# EasyEDA Pro project ProPrj_国赛底层板子_2026-05-31.epro, schematic 国赛底板b
Board Name: 国赛底板b; Create Date: 2025-09-20; Page Name: Sheet_1; Project Name: 底板b; Schematic Name: 国赛底板b; Update Date: 2025-09-20; Add into BOM: yes; Company: Your Company; Convert to PCB: yes; Date: 2024-07-17; Draw By: zjt55200; REV: 1.0; Sheet: 1/1
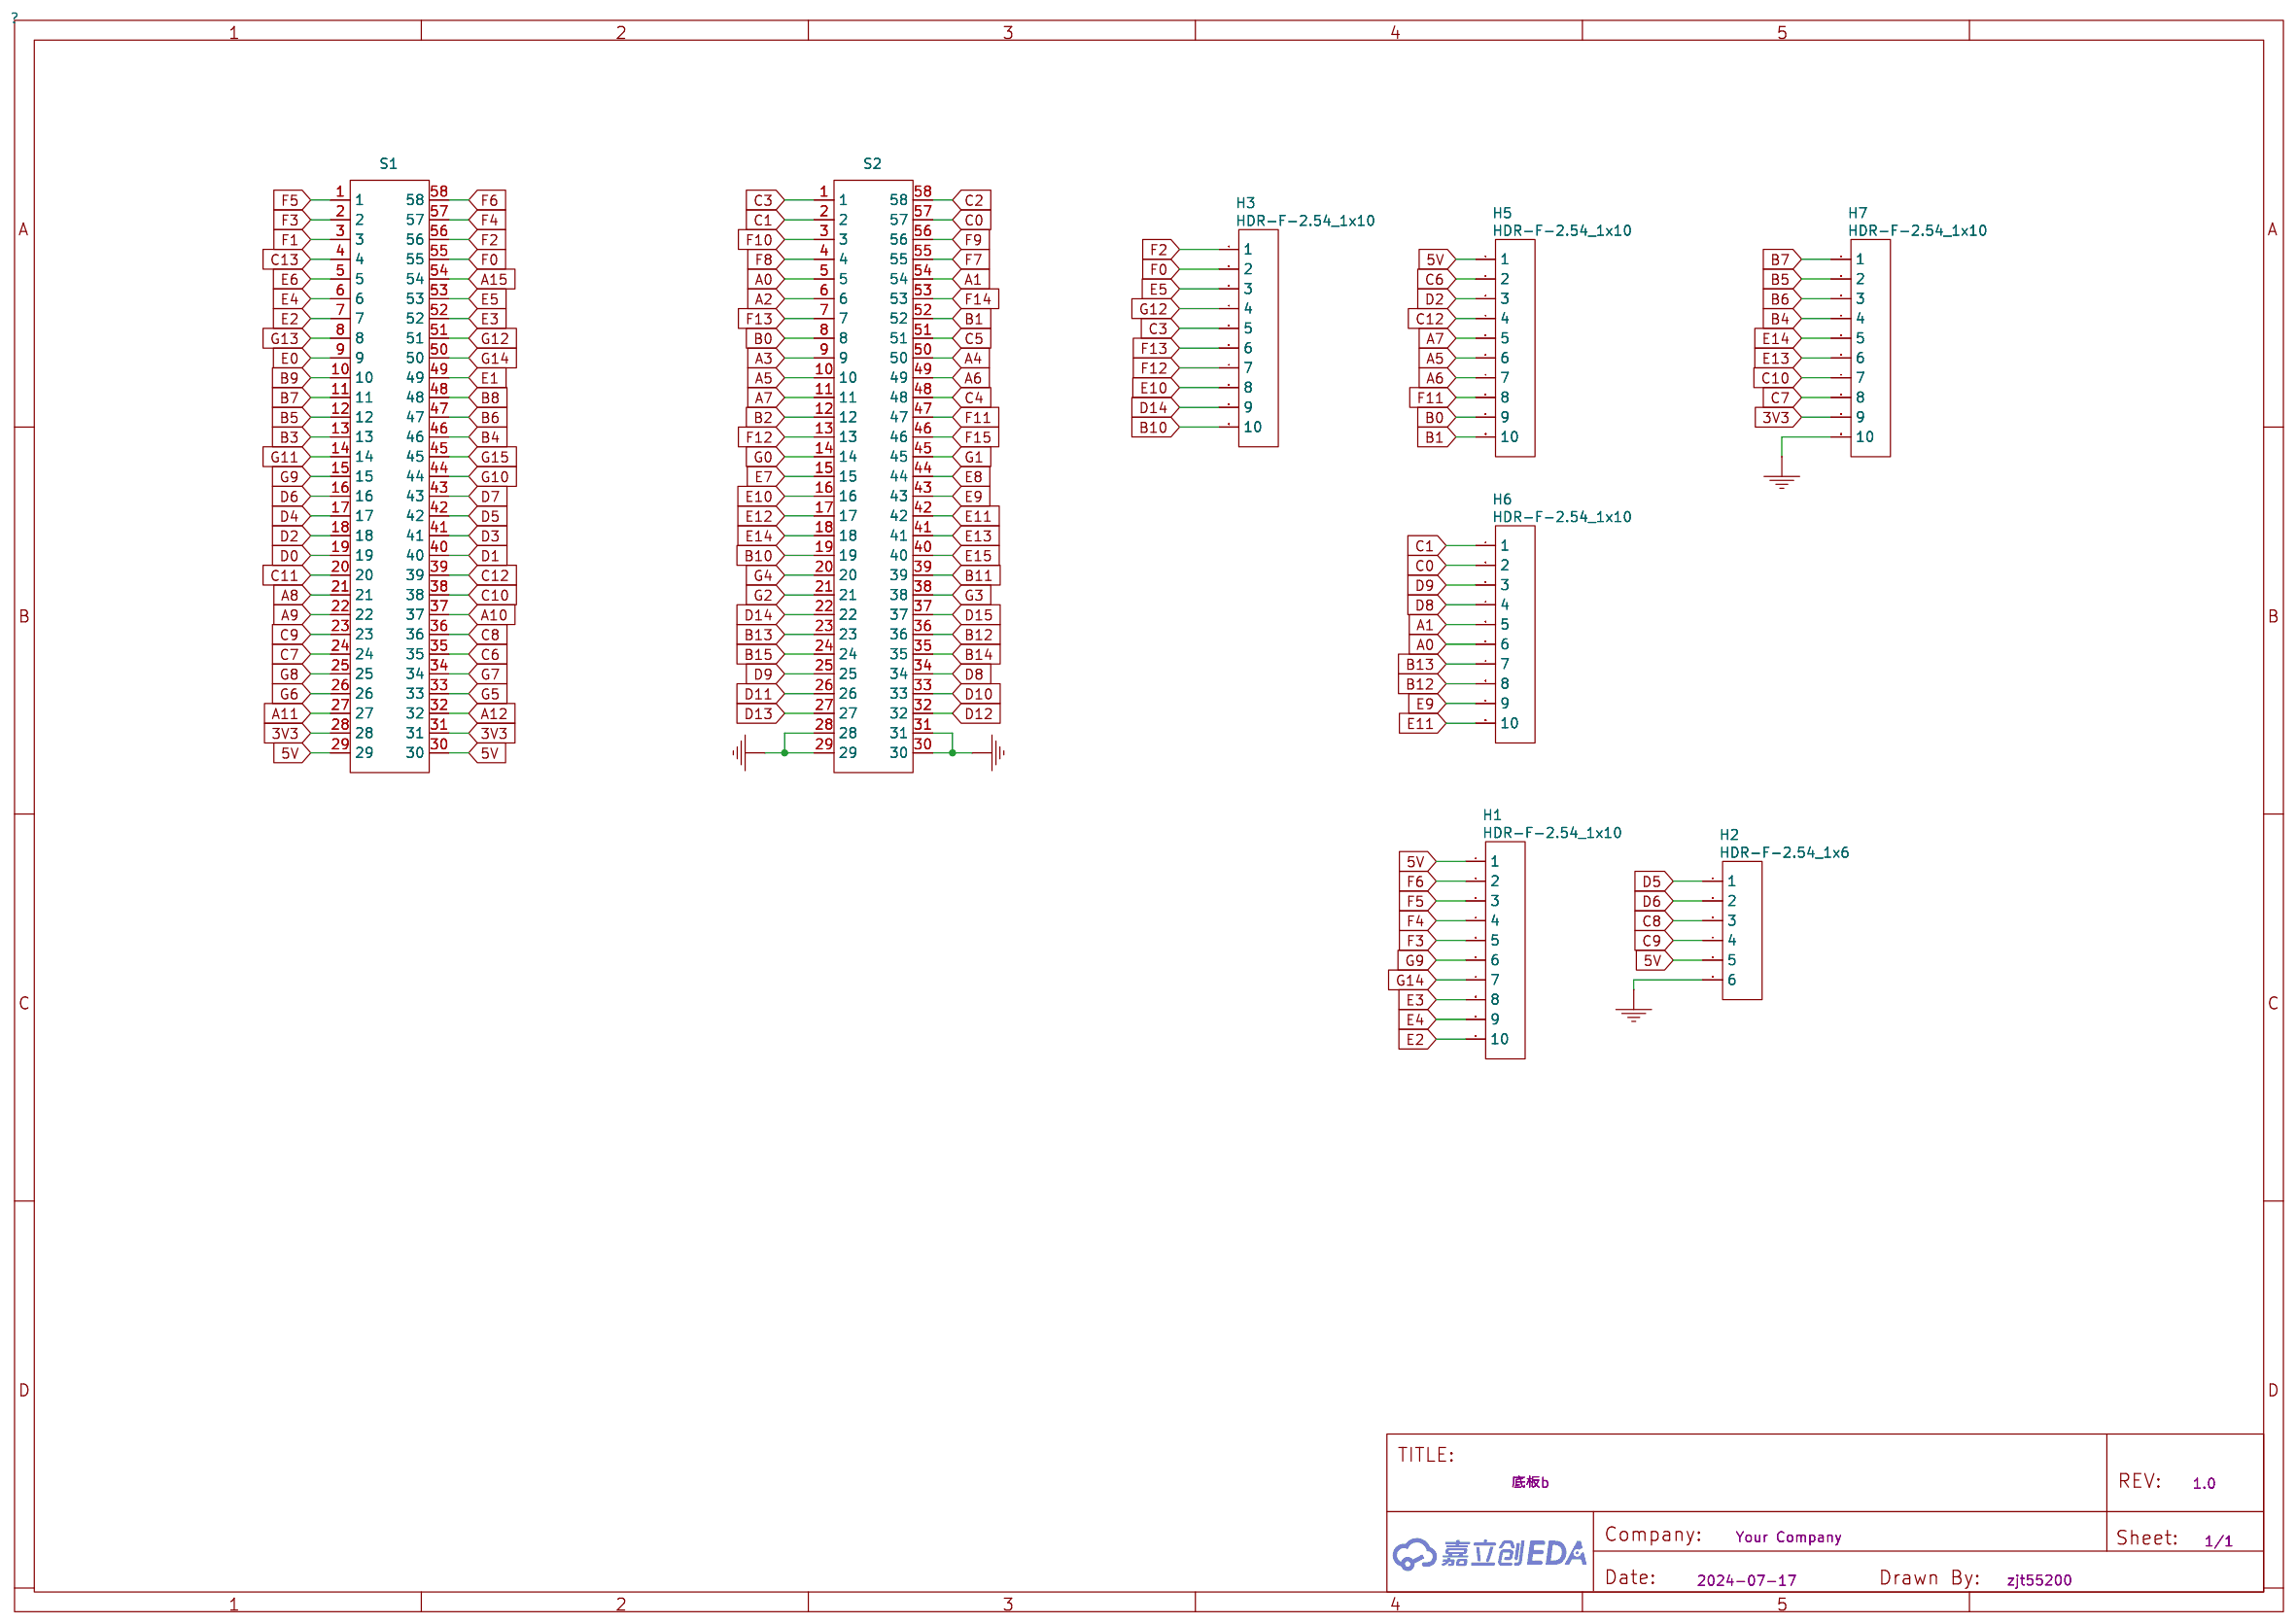
[diagram p3: schematic sheet]

## Parts
H1  HDR-F-2.54_1x10  [HDR-F-2.54_1X10]
H2  HDR-F-2.54_1x6  [HDR-F-2.54_1X6]
H3  HDR-F-2.54_1x10  [HDR-F-2.54_1X10]
H5  HDR-F-2.54_1x10  [HDR-F-2.54_1X10]
H6  HDR-F-2.54_1x10  [HDR-F-2.54_1X10]
H7  HDR-F-2.54_1x10  [HDR-F-2.54_1X10]
S1  双排29脚排针  [双排二十九]
S2  双排29脚排针  [双排二十九]

## Library data of the parts
H1 H3 H5-H7 = HDR-F-2.54_1x10: Supplier Part: C35445; Supplier: LCSC
H2 = HDR-F-2.54_1x6: Supplier Part: C40877; Supplier: LCSC
S1 S2 = 双排29脚排针

## Nets
3V3: H7.9 S1.28 S1.31
5V: H1.1 H2.5 H5.1 S1.29 S1.30
GND: H2.6 H7.10 S2.28 S2.29 S2.30 S2.31
A0: H6.6 S2.5
A1: H6.5 S2.54
A2: S2.6
A3: S2.9
A4: S2.50
A5: H5.6 S2.10
A6: H5.7 S2.49
A7: H5.5 S2.11
A8: S1.21
A9: S1.22
A10: S1.37
A11: S1.27
A12: S1.32
A15: S1.54
B0: H5.9 S2.8
B1: H5.10 S2.52
B2: S2.12
B3: S1.13
B4: H7.4 S1.46
B5: H7.2 S1.12
B6: H7.3 S1.47
B7: H7.1 S1.11
B8: S1.48
B9: S1.10
B10: H3.10 S2.19
B11: S2.39
B12: H6.8 S2.36
B13: H6.7 S2.23
B14: S2.35
B15: S2.24
C0: H6.2 S2.57
C1: H6.1 S2.2
C2: S2.58
C3: H3.5 S2.1
C4: S2.48
C5: S2.51
C6: H5.2 S1.35
C7: H7.8 S1.24
C8: H2.3 S1.36
C9: H2.4 S1.23
C10: H7.7 S1.38
C11: S1.20
C12: H5.4 S1.39
C13: S1.4
D0: S1.19
D1: S1.40
D2: H5.3 S1.18
D3: S1.41
D4: S1.17
D5: H2.1 S1.42
D6: H2.2 S1.16
D7: S1.43
D8: H6.4 S2.34
D9: H6.3 S2.25
D10: S2.33
D11: S2.26
D12: S2.32
D13: S2.27
D14: H3.9 S2.22
D15: S2.37
E0: S1.9
E1: S1.49
E2: H1.10 S1.7
E3: H1.8 S1.52
E4: H1.9 S1.6
E5: H3.3 S1.53
E6: S1.5
E7: S2.15
E8: S2.44
E9: H6.9 S2.43
E10: H3.8 S2.16
E11: H6.10 S2.42
E12: S2.17
E13: H7.6 S2.41
E14: H7.5 S2.18
E15: S2.40
F0: H3.2 S1.55
F1: S1.3
F2: H3.1 S1.56
F3: H1.5 S1.2
F4: H1.4 S1.57
F5: H1.3 S1.1
F6: H1.2 S1.58
F7: S2.55
F8: S2.4
F9: S2.56
F10: S2.3
F11: H5.8 S2.47
F12: H3.7 S2.13
F13: H3.6 S2.7
F14: S2.53
F15: S2.46
G0: S2.14
G1: S2.45
G2: S2.21
G3: S2.38
G4: S2.20
G5: S1.33
G6: S1.26
G7: S1.34
G8: S1.25
G9: H1.6 S1.15
G10: S1.44
G11: S1.14
G12: H3.4 S1.51
G13: S1.8
G14: H1.7 S1.50
G15: S1.45
